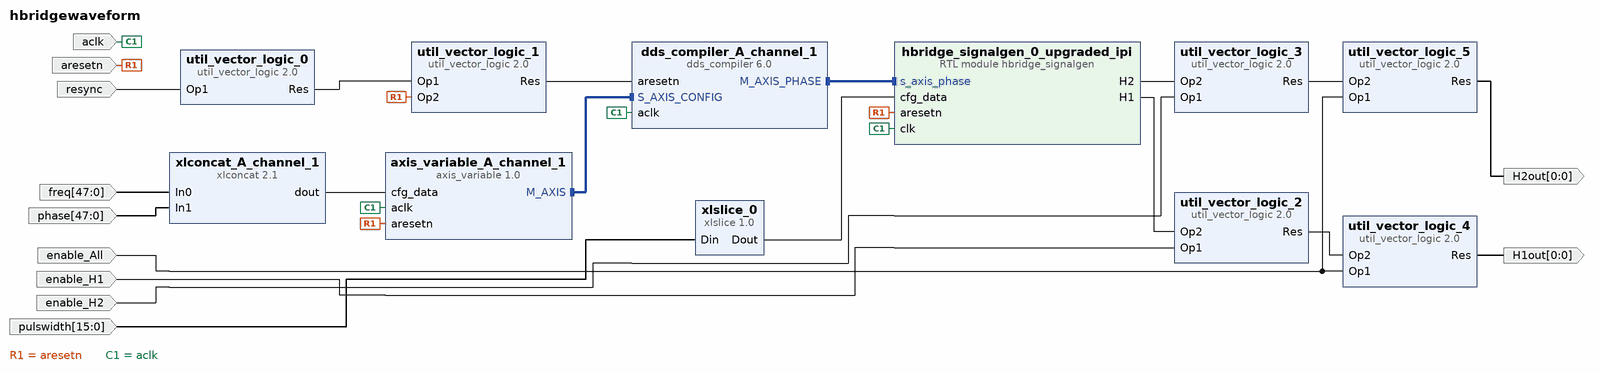
[diagram p0: block diagram of the top level]
# Vivado block design hbridgewaveform, xc7z010clg400-1, Vivado 2021.2
create_bd_design hbridgewaveform

create_bd_port -dir O -from 0 -to 0 -type data H1out
create_bd_port -dir O -from 0 -to 0 -type data H2out
create_bd_port -dir I -type clk aclk
set_property -dict {CONFIG.FREQ_HZ 125000000} [get_bd_ports aclk]
create_bd_port -dir I -type rst aresetn
create_bd_port -dir I enable_All
create_bd_port -dir I -type data enable_H1
create_bd_port -dir I -type data enable_H2
create_bd_port -dir I -from 47 -to 0 freq
create_bd_port -dir I -from 47 -to 0 phase
create_bd_port -dir I -from 15 -to 0 pulswidth
create_bd_port -dir I resync

create_bd_cell -type ip -vlnv pavel-demin:user:axis_variable:1.0 axis_variable_A_channel_1
set_property -dict {CONFIG.AXIS_TDATA_WIDTH 96} [get_bd_cells axis_variable_A_channel_1]
create_bd_cell -type ip -vlnv xilinx.com:ip:dds_compiler:6.0 dds_compiler_A_channel_1
set_property -dict [list \
  CONFIG.Amplitude_Mode Full_Range \
  CONFIG.DATA_Has_TLAST Not_Required \
  CONFIG.DDS_Clock_Rate 125 \
  CONFIG.Frequency_Resolution 0.4 \
  CONFIG.Has_ACLKEN false \
  CONFIG.Has_ARESETn true \
  CONFIG.Has_Phase_Out true \
  CONFIG.Has_TREADY false \
  CONFIG.Latency 2 \
  CONFIG.Latency_Configuration Auto \
  CONFIG.M_DATA_Has_TUSER Not_Required \
  CONFIG.M_PHASE_Has_TUSER Not_Required \
  CONFIG.Noise_Shaping None \
  CONFIG.Output_Frequency1 0 \
  CONFIG.Output_Selection Sine_and_Cosine \
  CONFIG.Output_Width 3 \
  CONFIG.PINC1 0 \
  CONFIG.POFF1 0 \
  CONFIG.Parameter_Entry Hardware_Parameters \
  CONFIG.PartsPresent Phase_Generator_only \
  CONFIG.Phase_Increment Programmable \
  CONFIG.Phase_Offset_Angles1 0 \
  CONFIG.Phase_Width 48 \
  CONFIG.Phase_offset Programmable \
  CONFIG.Resync false \
  CONFIG.S_PHASE_Has_TUSER Not_Required \
  CONFIG.Spurious_Free_Dynamic_Range 45 \
] [get_bd_cells dds_compiler_A_channel_1]
create_bd_cell -type module -reference hbridge_signalgen hbridge_signalgen_0_upgraded_ipi
set_property -dict {CONFIG.AXIS_TDATA_PHASE_WIDTH 48 CONFIG.CFG_DATA_WIDTH 14} [get_bd_cells hbridge_signalgen_0_upgraded_ipi]
create_bd_cell -type ip -vlnv xilinx.com:ip:util_vector_logic:2.0 util_vector_logic_0
set_property -dict {CONFIG.C_OPERATION not CONFIG.C_SIZE 1} [get_bd_cells util_vector_logic_0]
create_bd_cell -type ip -vlnv xilinx.com:ip:util_vector_logic:2.0 util_vector_logic_1
set_property -dict {CONFIG.C_SIZE 1} [get_bd_cells util_vector_logic_1]
create_bd_cell -type ip -vlnv xilinx.com:ip:util_vector_logic:2.0 util_vector_logic_2
set_property -dict {CONFIG.C_SIZE 1} [get_bd_cells util_vector_logic_2]
create_bd_cell -type ip -vlnv xilinx.com:ip:util_vector_logic:2.0 util_vector_logic_3
set_property -dict {CONFIG.C_SIZE 1} [get_bd_cells util_vector_logic_3]
create_bd_cell -type ip -vlnv xilinx.com:ip:util_vector_logic:2.0 util_vector_logic_4
set_property -dict {CONFIG.C_SIZE 1} [get_bd_cells util_vector_logic_4]
create_bd_cell -type ip -vlnv xilinx.com:ip:util_vector_logic:2.0 util_vector_logic_5
set_property -dict {CONFIG.C_SIZE 1} [get_bd_cells util_vector_logic_5]
create_bd_cell -type ip -vlnv xilinx.com:ip:xlconcat:2.1 xlconcat_A_channel_1
set_property -dict [list \
  CONFIG.IN0_WIDTH 48 \
  CONFIG.IN1_WIDTH 48 \
  CONFIG.IN2_WIDTH 8 \
  CONFIG.NUM_PORTS 2 \
] [get_bd_cells xlconcat_A_channel_1]
create_bd_cell -type ip -vlnv xilinx.com:ip:xlslice:1.0 xlslice_0
set_property -dict {CONFIG.DIN_FROM 13 CONFIG.DIN_WIDTH 16 CONFIG.DOUT_WIDTH 14} [get_bd_cells xlslice_0]

# ---- connections ----

connect_bd_intf_net [get_bd_intf_pins axis_variable_A_channel_1/M_AXIS] [get_bd_intf_pins dds_compiler_A_channel_1/S_AXIS_CONFIG]
connect_bd_intf_net [get_bd_intf_pins dds_compiler_A_channel_1/M_AXIS_PHASE] [get_bd_intf_pins hbridge_signalgen_0_upgraded_ipi/s_axis_phase]
connect_bd_net [get_bd_ports aresetn] \
  [get_bd_pins axis_variable_A_channel_1/aresetn] [get_bd_pins hbridge_signalgen_0_upgraded_ipi/aresetn] \
  [get_bd_pins util_vector_logic_1/Op2]
connect_bd_net -net clk_wiz_0_clk_internal [get_bd_ports aclk] \
  [get_bd_pins axis_variable_A_channel_1/aclk] [get_bd_pins dds_compiler_A_channel_1/aclk] \
  [get_bd_pins hbridge_signalgen_0_upgraded_ipi/clk]
connect_bd_net [get_bd_ports enable_All] [get_bd_pins util_vector_logic_4/Op1] [get_bd_pins util_vector_logic_5/Op1]
connect_bd_net -net enable_H1_1 [get_bd_ports enable_H1] [get_bd_pins util_vector_logic_2/Op1]
connect_bd_net -net enable_H2_1 [get_bd_ports enable_H2] [get_bd_pins util_vector_logic_3/Op1]
connect_bd_net [get_bd_ports freq] [get_bd_pins xlconcat_A_channel_1/In0]
connect_bd_net [get_bd_pins hbridge_signalgen_0_upgraded_ipi/H1] [get_bd_pins util_vector_logic_2/Op2]
connect_bd_net [get_bd_pins hbridge_signalgen_0_upgraded_ipi/H2] [get_bd_pins util_vector_logic_3/Op2]
connect_bd_net [get_bd_ports phase] [get_bd_pins xlconcat_A_channel_1/In1]
connect_bd_net [get_bd_ports pulswidth] [get_bd_pins xlslice_0/Din]
connect_bd_net [get_bd_ports resync] [get_bd_pins util_vector_logic_0/Op1]
connect_bd_net [get_bd_pins util_vector_logic_0/Res] [get_bd_pins util_vector_logic_1/Op1]
connect_bd_net [get_bd_pins util_vector_logic_1/Res] [get_bd_pins dds_compiler_A_channel_1/aresetn]
connect_bd_net [get_bd_pins util_vector_logic_2/Res] [get_bd_pins util_vector_logic_4/Op2]
connect_bd_net [get_bd_pins util_vector_logic_3/Res] [get_bd_pins util_vector_logic_5/Op2]
connect_bd_net [get_bd_pins util_vector_logic_4/Res] [get_bd_ports H1out]
connect_bd_net [get_bd_pins util_vector_logic_5/Res] [get_bd_ports H2out]
connect_bd_net [get_bd_pins xlconcat_A_channel_1/dout] [get_bd_pins axis_variable_A_channel_1/cfg_data]
connect_bd_net [get_bd_pins xlslice_0/Dout] [get_bd_pins hbridge_signalgen_0_upgraded_ipi/cfg_data]

validate_bd_design
save_bd_design
